# Altium project AIR_SENSE.PrjPcb
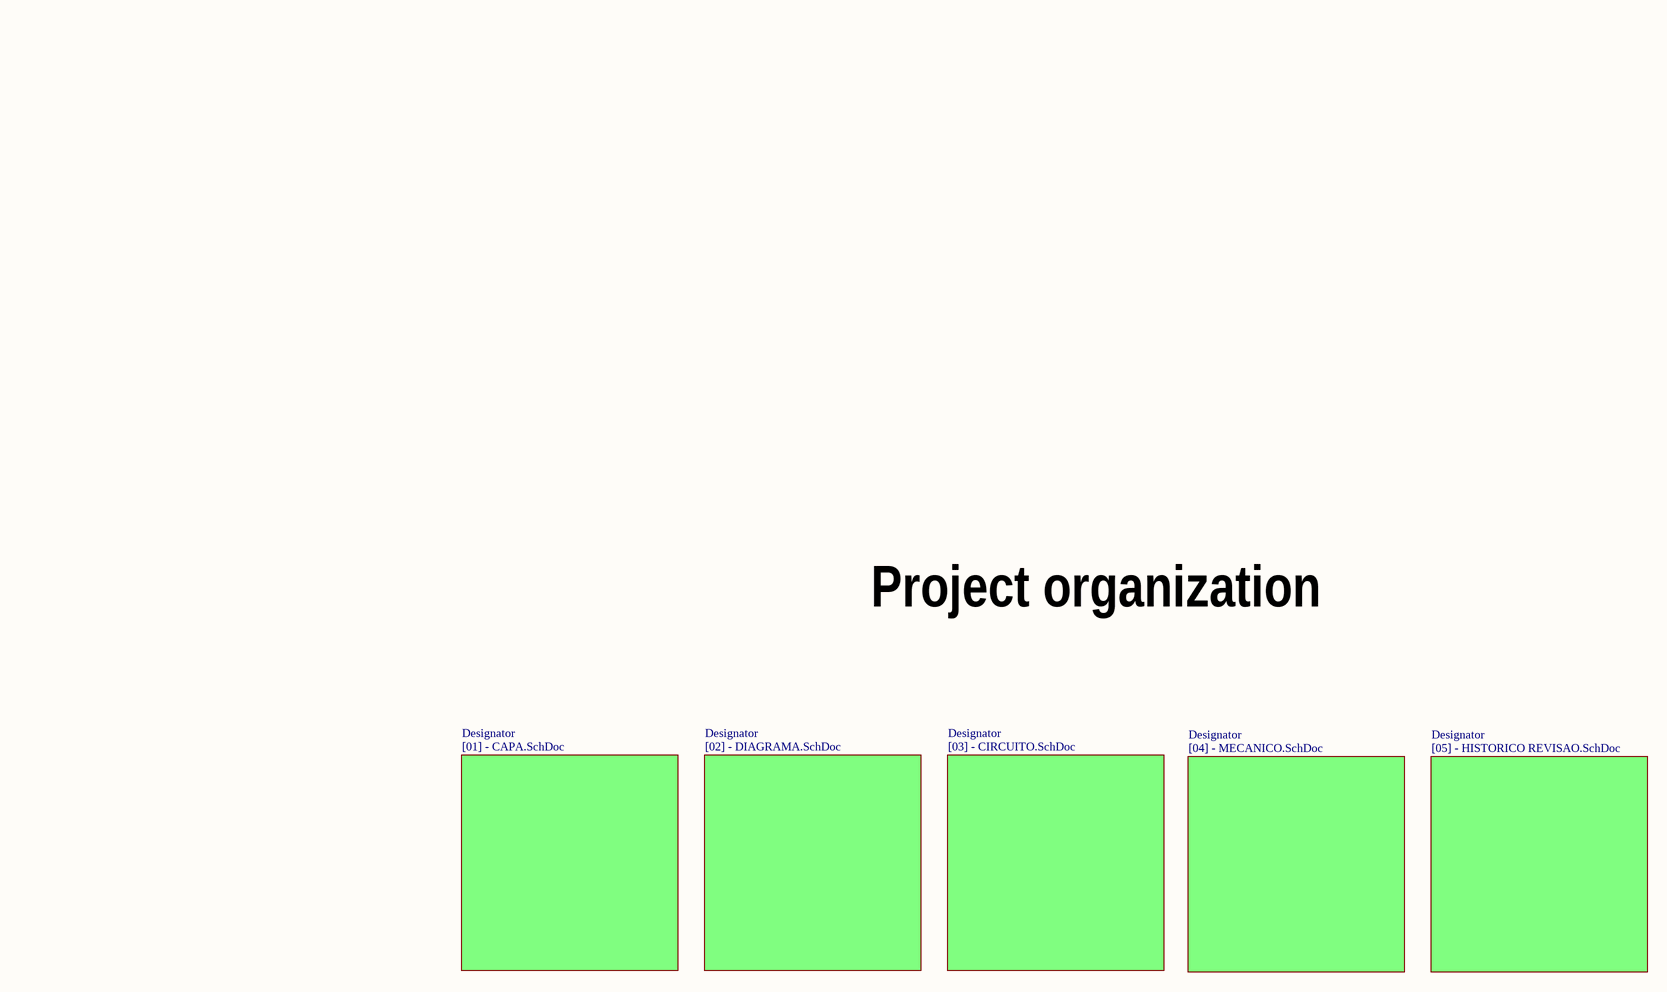
[diagram p0: AIR_SENSE.SchDoc]
VersionRevision: V1I1; Project: AIR SENSE; EngineerName: João P. Bino e Rauhe Abdulhamid; Currency: BR; Assembly_Variant: Completa
6 sheets, 26 parts. Net scope: global (net labels, ports and power ports of the same name join across sheets).
Board file: AIR_SENSE.PcbDoc
Sheets:
  AIR_SENSE.SchDoc
    Designator = [01] - CAPA.SchDoc
    Designator = [02] - DIAGRAMA.SchDoc
    Designator = [03] - CIRCUITO.SchDoc
    Designator = [04] - MECANICO.SchDoc
    Designator = [05] - HISTORICO REVISAO.SchDoc

## Sheet AIR_SENSE.SchDoc
size A3; CompanyName: KDS; Organization: KDS; DocumentNumber: 1; Revision: V1I1; SheetNumber: 1; SheetTotal: 6; PageSetup: Record=PageOptions|CenterHorizontal=True|CenterVertical=True|PrintScale=1.07|XCorrection=1.00|YCorrection=1.00|PrintKind=1|BorderSize=5000000|LeftOffset=0|BottomOffset=0|Orientation=2|PaperLength=1000|PaperWidth=1000|Scale=100|PaperSource=7|PrintQuality=600|MediaType=1|DitherType=10|PaperKind=A3|PrintScaleMode=1; ProjectName: KDS C6A816x Module

### Sub-sheets
Designator = [01] - CAPA.SchDoc: no entries
Designator = [02] - DIAGRAMA.SchDoc: no entries
Designator = [03] - CIRCUITO.SchDoc: no entries
Designator = [04] - MECANICO.SchDoc: no entries
Designator = [05] - HISTORICO REVISAO.SchDoc: no entries

### Notes on the sheet
- Project organization
- Project:
- Revision:
- Engineer:
- Title:
- Pag
- of
- Embedded Things
- Date:
- Hour:
- Variant:

## Sheet [01] - CAPA.SchDoc
size A3; DocumentNumber: 2; SheetNumber: 2; SheetTotal: 6
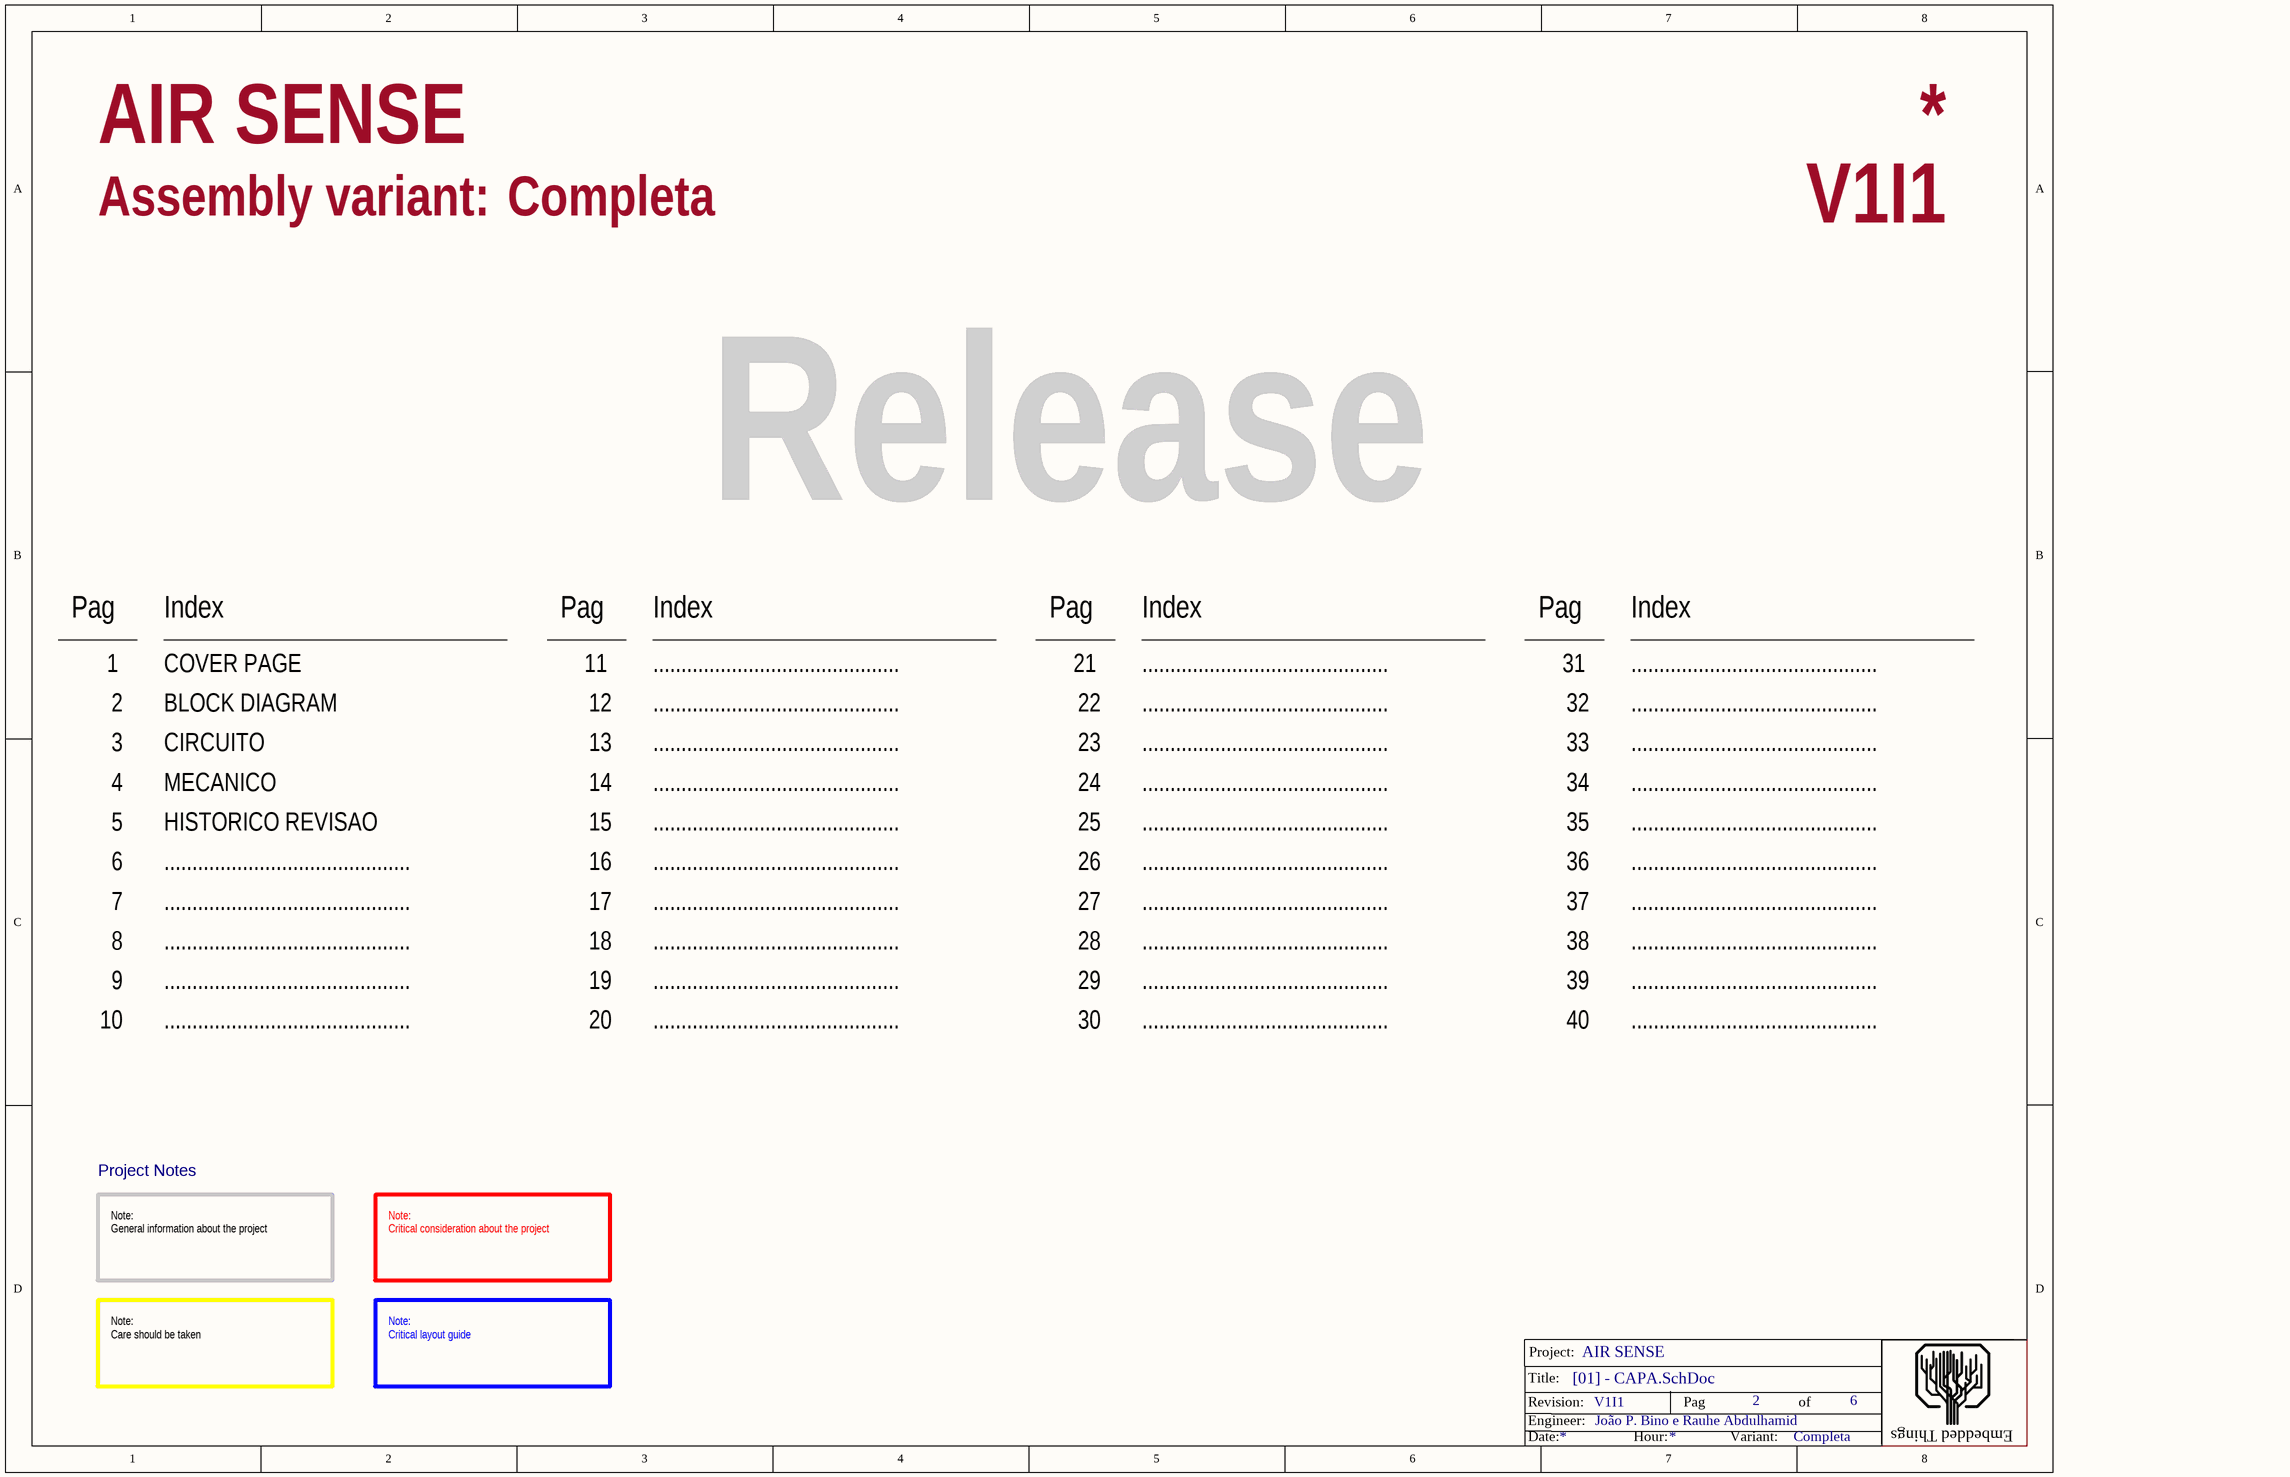
[diagram p1: [01] - CAPA.SchDoc]

### Notes on the sheet
- Assembly variant:
- Release
- Pag
- Index
- 1
- COVER PAGE
- 11
- ............................................
- 21
- 31
- 2
- 3
- BLOCK DIAGRAM
- CIRCUITO
- 12
- 13
- 22
- 23
- 32
- 33
- 4
- 5
- MECANICO
- HISTORICO REVISAO
- 14
- 15
- 24
- 25
- 34
- 35
- 6
- 16
- 26
- 36
- 7
- 8
- 17
- 18
- 27
- 28
- 37
- 38
- 9
- 10
- 19
- 20
- 29
- 30
- 39
- 40
- Project Notes
- Note:
  General information about the project
- Note:
  Critical consideration about the project
- Note:
  Care should be taken
- Note:
  Critical layout guide
- Project:
- Revision:
- Engineer:
- Title:
- of
- Embedded Things
- Date:
- Hour:
- Variant:

## Sheet [02] - DIAGRAMA.SchDoc
size A3; DocumentNumber: 3; SheetNumber: 3; SheetTotal: 6
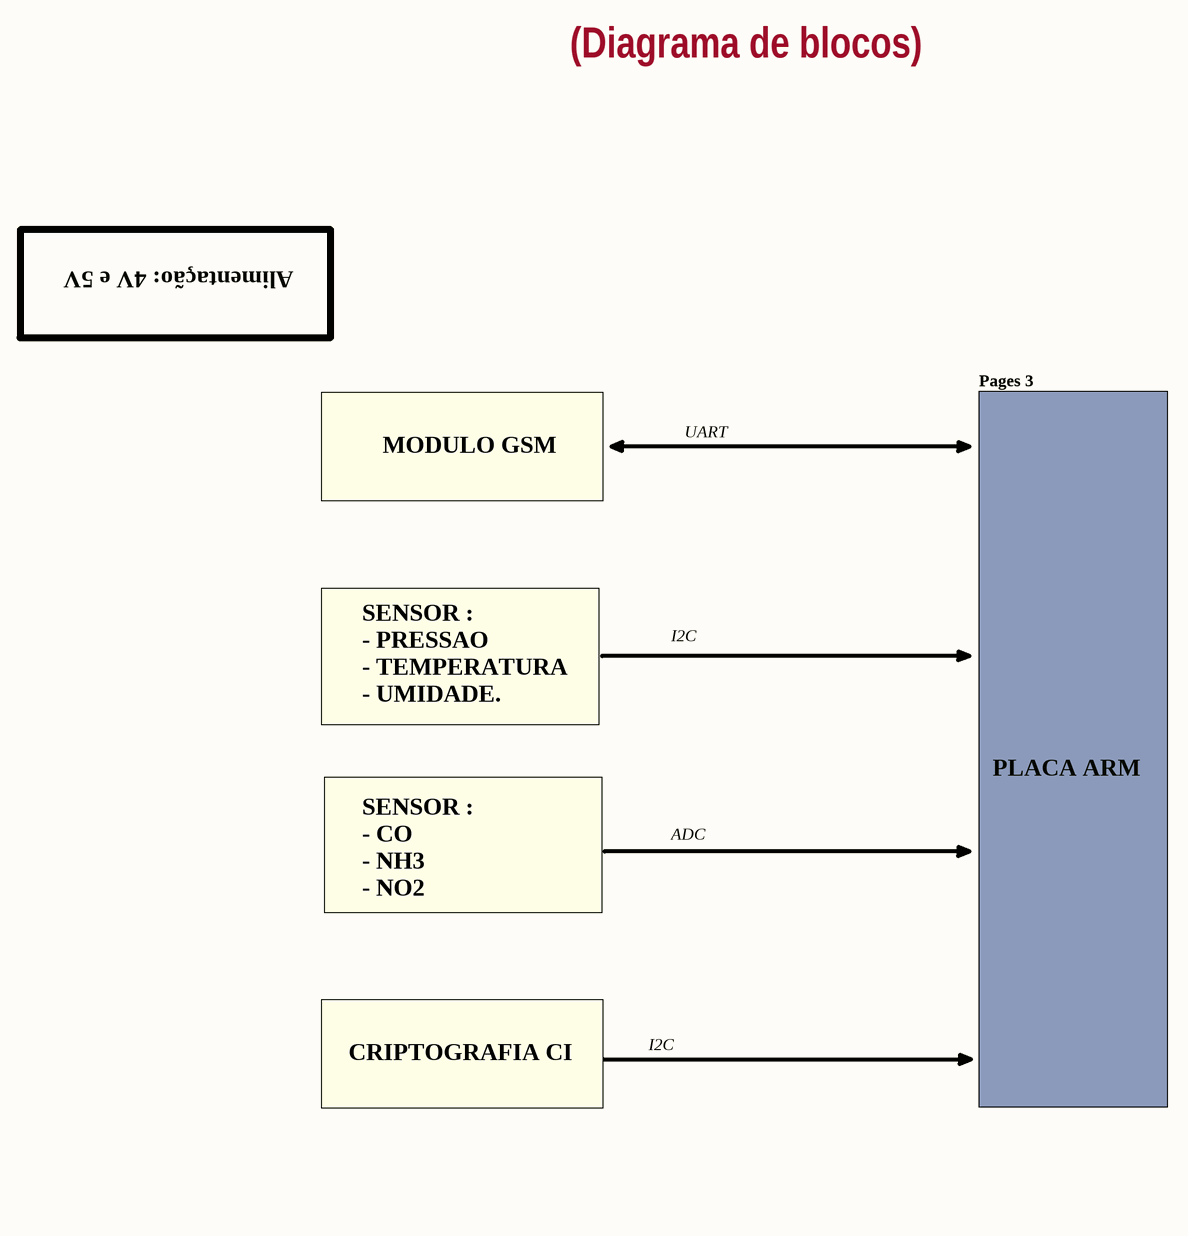
[diagram p2: [02] - DIAGRAMA.SchDoc]

### Notes on the sheet
- (Diagrama de blocos)
- Alimentação: 4V e 5V
- Pages 3
- MODULO GSM
- UART
- I2C
- SENSOR :
  - PRESSAO
  - TEMPERATURA
  - UMIDADE.
- PLACA ARM
- ADC
- SENSOR :
  - CO
  - NH3
  - NO2
- CRIPTOGRAFIA CI
- CLOCKS (CPU & PCIE)
- Project:
- Revision:
- Engineer:
- Title:
- Pag
- of
- Embedded Things
- Date:
- Hour:
- Variant:

## Sheet [03] - CIRCUITO.SchDoc
size A3; DocumentNumber: 4; SheetNumber: 4; SheetTotal: 6
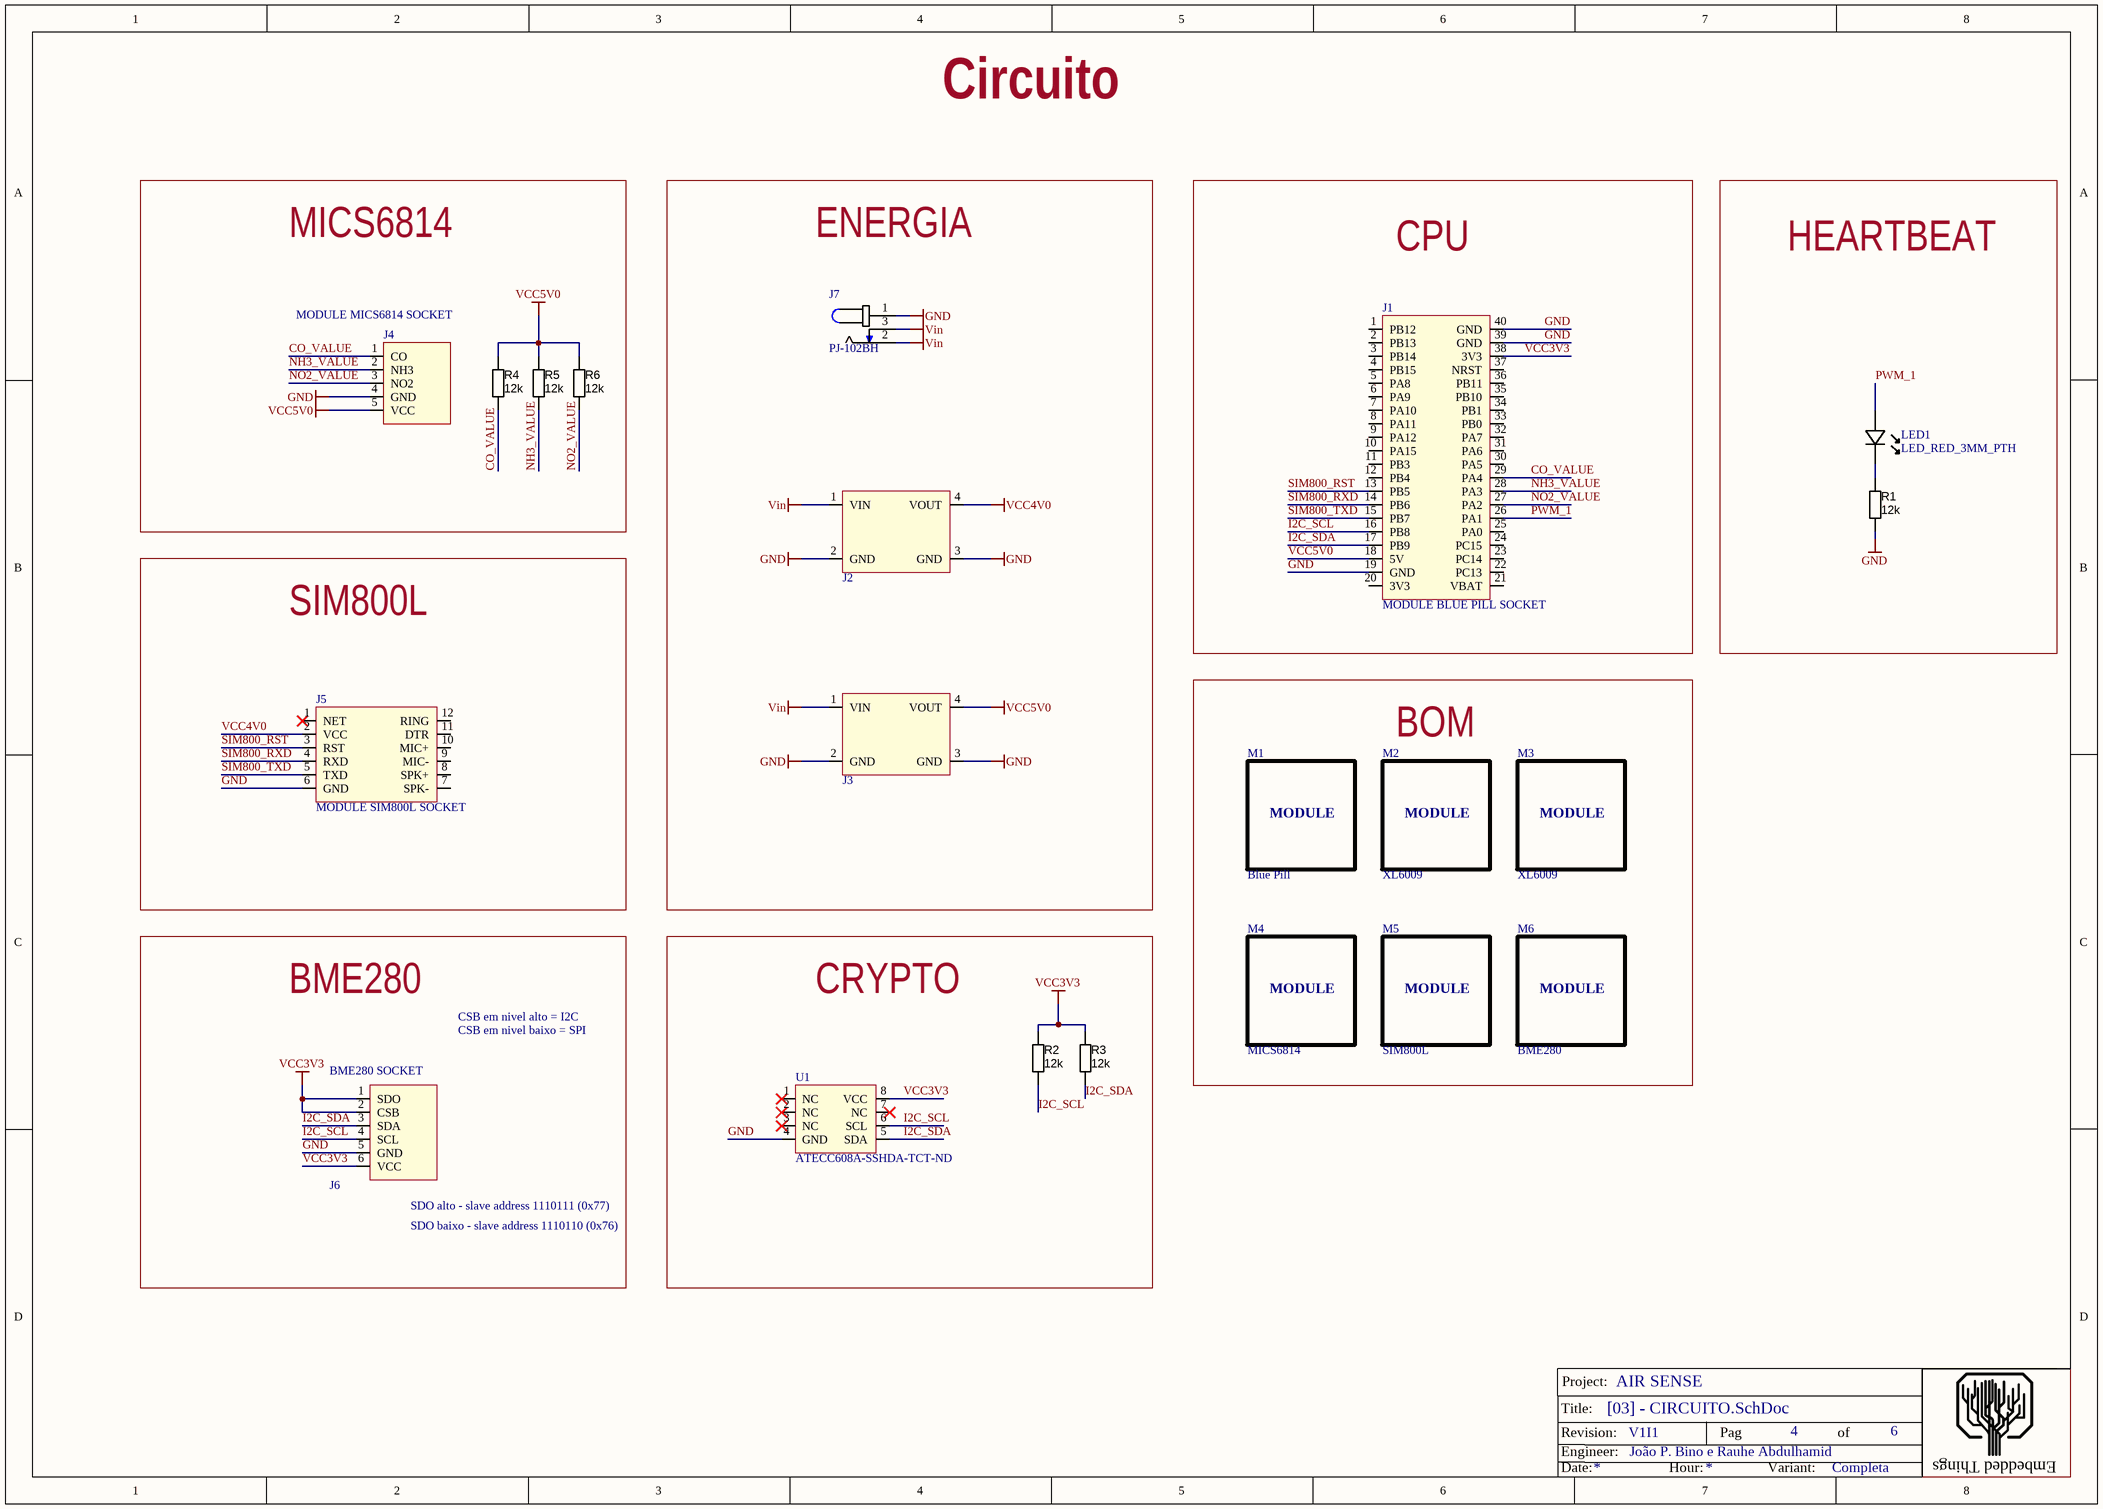
[diagram p3: [03] - CIRCUITO.SchDoc]

### Parts
J1  MODULE BLUE PILL SOCKET  [MODULE BLUE PILL SOCKET]
J2  XL6009  [MODULE DC-DC XL6009 SOCKET]  (value not drawn)
J3  XL6009  [MODULE DC-DC XL6009 SOCKET]  (value not drawn)
J4  MODULE MICS6814 SOCKET  [MODULE MICS6814 SOCKET]
J5  MODULE SIM800L SOCKET  [MODULE SIM800L SOCKET]
J6  Socket  [MODULE BME280 SOCKET]  (value not drawn)
J7  PJ-102BH  [CUI_PJ-102BH]
LED1  LED_RED_3MM_PTH  [LED-3MM-RED]
M1  Blue Pill
M2  XL6009
M3  XL6009
M4  MICS6814
M5  SIM800L
M6  BME280
R1  value 12k  [RESTH_AXIAL-0.4]  (hidden comment: Carbon Film)
R2  value 12k  [RESTH_AXIAL-0.4]  (hidden comment: Carbon Film)
R3  value 12k  [RESTH_AXIAL-0.4]  (hidden comment: Carbon Film)
R4  value 12k  [RESTH_AXIAL-0.4]  (hidden comment: Carbon Film)
R5  value 12k  [RESTH_AXIAL-0.4]  (hidden comment: Carbon Film)
R6  value 12k  [RESTH_AXIAL-0.4]  (hidden comment: Carbon Film)
U1  Supplier Part Number 1: ATECC608A-SSHDA-TCT-ND  [SOIC127P600X175-8AN]  (hidden comment: Authentication Chip)

### Blocks framed on the sheet
MICS6814: J4 R4-R6
ENERGIA: J2 J3 J7
CPU: J1
HEARTBEAT: LED1 R1
SIM800L: J5
BOM: M1-M6
BME280: J6
CRYPTO: R2 R3 U1

### Nets
GND: J1.19(GND) J1.39(GND) J1.40(GND) J2.2(GND) J2.3(GND) J3.2(GND) J3.3(GND) J4.4(GND) J5.6(GND) J6.5(GND) J7.1 R1.1 U1.4(GND)
VCC3V3: J1.38(3V3) J6.1(SDO) J6.2(CSB) J6.6(VCC) R2.2 R3.2 U1.8(VCC)
VCC4V0: J2.4(VOUT) J5.2(VCC)
VCC5V0: J1.18(5V) J3.4(VOUT) J4.5(VCC) R4.2 R5.2 R6.2
Vin: J2.1(VIN) J3.1(VIN) J7.2 J7.3
CO_VALUE: J1.29(PA4) J4.1(CO) R4.1
I2C_SCL: J1.16(PB8) J6.4(SCL) R2.1 U1.6(SCL)
I2C_SDA: J1.17(PB9) J6.3(SDA) R3.1 U1.5(SDA)
NH3_VALUE: J1.28(PA3) J4.2(NH3) R5.1
NO2_VALUE: J1.27(PA2) J4.3(NO2) R6.1
PWM_1: J1.26(PA1) LED1.A
SIM800_RST: J1.13(PB5) J5.3(RST)
SIM800_RXD: J1.14(PB6) J5.4(RXD)
SIM800_TXD: J1.15(PB7) J5.5(TXD)
NetLED1_K: LED1.K R1.2

Not connected (* = marked no-connect by the designer): J1 1(PB12) 2(PB13) 3(PB14) 4(PB15) 5(PA8) 6(PA9) 7(PA10) 8(PA11) 9(PA12) 10(PA15) 11(PB3) 12(PB4) 20(3V3) 21(VBAT) 22(PC13) 23(PC14) 24(PC15) 25(PA0) 30(PA5) 31(PA6) 32(PA7) 33(PB0) 34(PB1) 35(PB10) 36(PB11) 37(NRST); J5 1(NET)* 7(SPK-) 8(SPK+) 9(MIC-) 10(MIC+) 11(DTR) 12(RING); U1 1(NC)* 2(NC)* 3(NC)* 7(NC)*

### Notes on the sheet
- Circuito
- CSB em nivel alto = I2C
- CSB em nivel baixo = SPI
- (near J6) SDO alto - slave address 1110111 (0x77)
- SDO baixo - slave address 1110110 (0x76)
- Project:
- Revision:
- Engineer:
- Title:
- Pag
- of
- Embedded Things
- Date:
- Hour:
- Variant:
- (in symbol MODULE BLUE PILL) MODULE
- (in symbol MODULE BME280) MODULE
- (in symbol MODULE BME280 SOCKET) BME280 SOCKET
- (in symbol MODULE DC-DC XL6009) MODULE
- (in symbol MODULE MICS6814) MODULE
- (in symbol MODULE SIM800L) MODULE

### Library data of the parts
J2 J3 = MODULE DC-DC XL6009 SOCKET
J6 = MODULE BME280 SOCKET: CONN HEADER FEMALE 6POS .1" GOLD; Manufacturer: Sullins Connector Solutions; Manufacturer Part Number: PPPC061LFBN-RC; Number of Positions: 6; Number of Positions Loaded: All; Pitch: 0.100" (2.54mm); Supplier 1: Digi-Key; RoHS: RoHS Compliant; Category: Connectors, Interconnects; Stock 1: 15924; Pricing 1: 1=0.7, 10=0.546, 25=0.5088, 50=0.4626, 100=0.4163, 250=0.35152, 500=0.333, 1000=0.296, 2500=0.24605 (USD); Packaging: Bulk; Connector Type: Header; Contact Type: Female Socket; Number of Rows: 1; Row Spacing: -; Mounting Type: Through Hole; Termination: Solder; Fastening Type: -; Features: -; Contact Finish: Gold; Contact Finish Thickness: Flash; Color: Black; ComponentLink1URL: http://www.sullinscorp.com/drawings/78_P(N)PxCxxxLFBN-RC,_10492-H.pdf; ComponentLink1Description: http://www.sullinscorp.com/drawings/78_P(N)PxCxxxLFBN-RC,_10492-H.pdf; Supplier Part Number 1: S7039-ND
J7 = PJ-102BH: CONN PWR JACK 2.5X5.5MM SOLDER; Manufacturer: CUI Inc.; Gender: Male; Industry Recognized Mating Diameter: 2.50mm ID (0.098"), 5.50mm OD (0.217"); Actual Diameter: 0.098" (2.50mm ID), 0.256" (6.50mm OD); Number of Positions/Contacts: 2 Conductors, 3 Contacts; Internal Switch(s): Single Switch, Normally Closed; Shielding: Unshielded; Voltage - Rated: 24VDC; Mating Length/Depth: 0.354" (9.00mm); Body Color: Black; Material Flammability Rating: UL94 V-0; Value: *; Supplier 1: Digi-Key; Manufacturer Part Number: PJ-102BH; RoHS: RoHS Compliant; Category: Connectors, Interconnects; Stock 1: 7742; Pricing 1: 1=0.77, 10=0.72, 25=0.648, 50=0.576, 100=0.552, 280=0.504, 560=0.48, 1120=0.396, 2520=0.36 (USD); Packaging: Tray; Part Status: Active; Connector Type: Jack; Mounting Type: Through Hole, Right Angle; Mounting Feature: -; Termination: Solder; Features: -; Insulation Color: -; Ingress Protection: -; Contact Material - Plating: Silver; Body Material: -; Operating Temperature: -25°C ~ 85°C; Includes: -; Housing Material: Polybutylene Terephthalate (PBT); Contact Material: Brass; Copper Alloy; Thread Size: -; ComponentLink1URL: https://www.cui.com/product/resource/digikeypdf/pj-102bh.pdf; ComponentLink1Description: https://www.cui.com/product/resource/digikeypdf/pj-102bh.pdf; Supplier Part Number 1: CP-102BH-ND
LED1 = LED_RED_3MM_PTH: LED RED 650NM 3MM RND; Manufacturer: Marktech Optoelectronics; Manufacturer Part Number: MT1403-RG-A; Wavelength - Peak: 700nm; Millicandela Rating: 5mcd; Voltage - Forward (Vf) (Typ): 2.1V; Current - Test: 20mA; Viewing Angle: 35°; Lens Transparency: Clear; Lens Style/Size: Round with Domed Top, 3.00mm; Supplier 1: Digi-Key; RoHS: RoHS Compliant; Category: Optoelectronics; Stock 1: 5274; Pricing 1: 1=0.3, 10=0.219, 25=0.1612, 100=0.115, 250=0.0782, 500=0.069, 1000=0.05405, 2500=0.0529, 5000=0.046 (USD); Packaging: Bulk; Color: Red; Wavelength - Dominant: 650nm; Lens Color: Red; Package / Case: Radial; Supplier Device Package: 3.0mm Round; Size / Dimension: -; Height (Max): 5.10mm; Mounting Type: Through Hole; ComponentLink1URL: http://www.marktechopto.com/products/datasheet/MT1403-RG-A; ComponentLink1Description: http://www.marktechopto.com/products/datasheet/MT1403-RG-A; Supplier Part Number 1: 1125-1182-ND
M1 = MODULE BLUE PILL
M2 M3 = MODULE DC-DC XL6009
M4 = MODULE MICS6814
M5 = MODULE SIM800L
M6 = MODULE BME280
R1-R6 = RES_12K_Axial_0.25W_5%: Resistor THD Axial 12k Ohm 0.25W 5% Carbon Film; Manufacturer 1: Yageo; Manufacturer Part Number 1: CFR-25JB-12K; Ratings: 1/4W; SCDType: spec; Tolerance: ±5%; Package / Case: Axial; Supplier 1: Digi-Key; Supplier Part Number 1: 12KQBK-ND
U1 = ATECC608: Authentication Chip IC Networking and Communications 8-SOIC; Manufacturer: Microchip Technology; Manufacturer Part Number: ATECC608A-SSHDA-T; Supplier 1: Digi-Key; RoHS: RoHS Compliant; Category: Integrated Circuits (ICs); Stock 1: 172; Pricing 1: 1=0.91, 25=0.8644 (USD); Packaging: Cut Tape (CT); Part Status: Active; Type: Authentication Chip; Applications: Networking and Communications; Mounting Type: Surface Mount; Package / Case: 8-SOIC (0.154", 3.90mm Width); Supplier Device Package: 8-SOIC; ComponentLink1URL: http://www.microchip.com/mymicrochip/filehandler.aspx?ddocname=en601565; ComponentLink1Description: http://www.microchip.com/mymicrochip/filehandler.aspx?ddocname=en601565

## Sheet [04] - MECANICO.SchDoc
size A4; DocumentNumber: 5; SheetNumber: 5; SheetTotal: 6
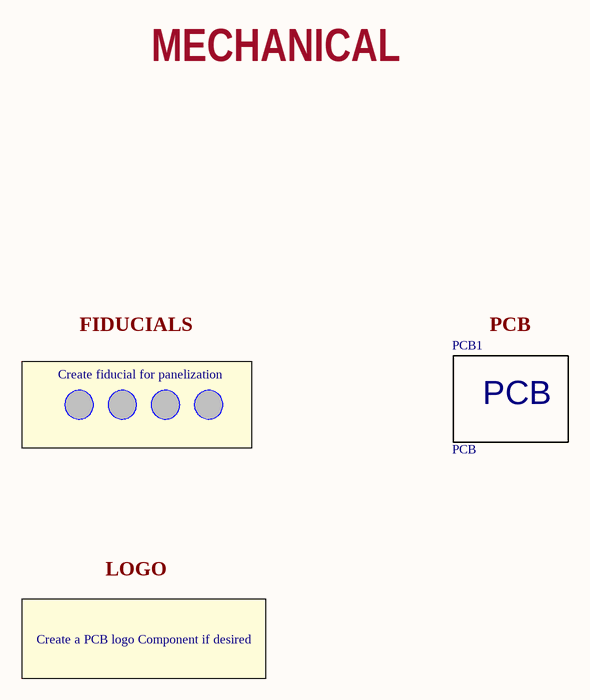
[diagram p4: [04] - MECANICO.SchDoc]

### Parts
FID1  FIDUCIAL  [FIDUCIAL - 1.27mm]  (value not drawn)  (no BOM)
FID2  FIDUCIAL  [FIDUCIAL - 1.27mm]  (value not drawn)  (no BOM)
FID3  FIDUCIAL  [FIDUCIAL - 1.27mm]  (value not drawn)  (no BOM)
FID4  FIDUCIAL  [FIDUCIAL - 1.27mm]  (value not drawn)  (no BOM)
PCB1  PCB

### Blocks framed on the sheet
Create fiducial for panelization: FID1-FID4

### Notes on the sheet
- MECHANICAL
- FIDUCIALS
- PCB
- LOGO
- Create a PCB logo Component if desired
- Project:
- Revision:
- Engineer:
- Title:
- Page
- of
- Embedded Things
- Date:
- Hour:
- Variant:

### Library data of the parts
FID1-FID4 = FIDUCIAL: Pad size: 1.27mm; Value: FIDUCIAL
PCB1 = PCB: Category: Printed Circuit Board

## Sheet [05] - HISTORICO REVISAO.SchDoc
size A3; Engineer: jpnbino; DocumentNumber: 6; SheetNumber: 6; SheetTotal: 6
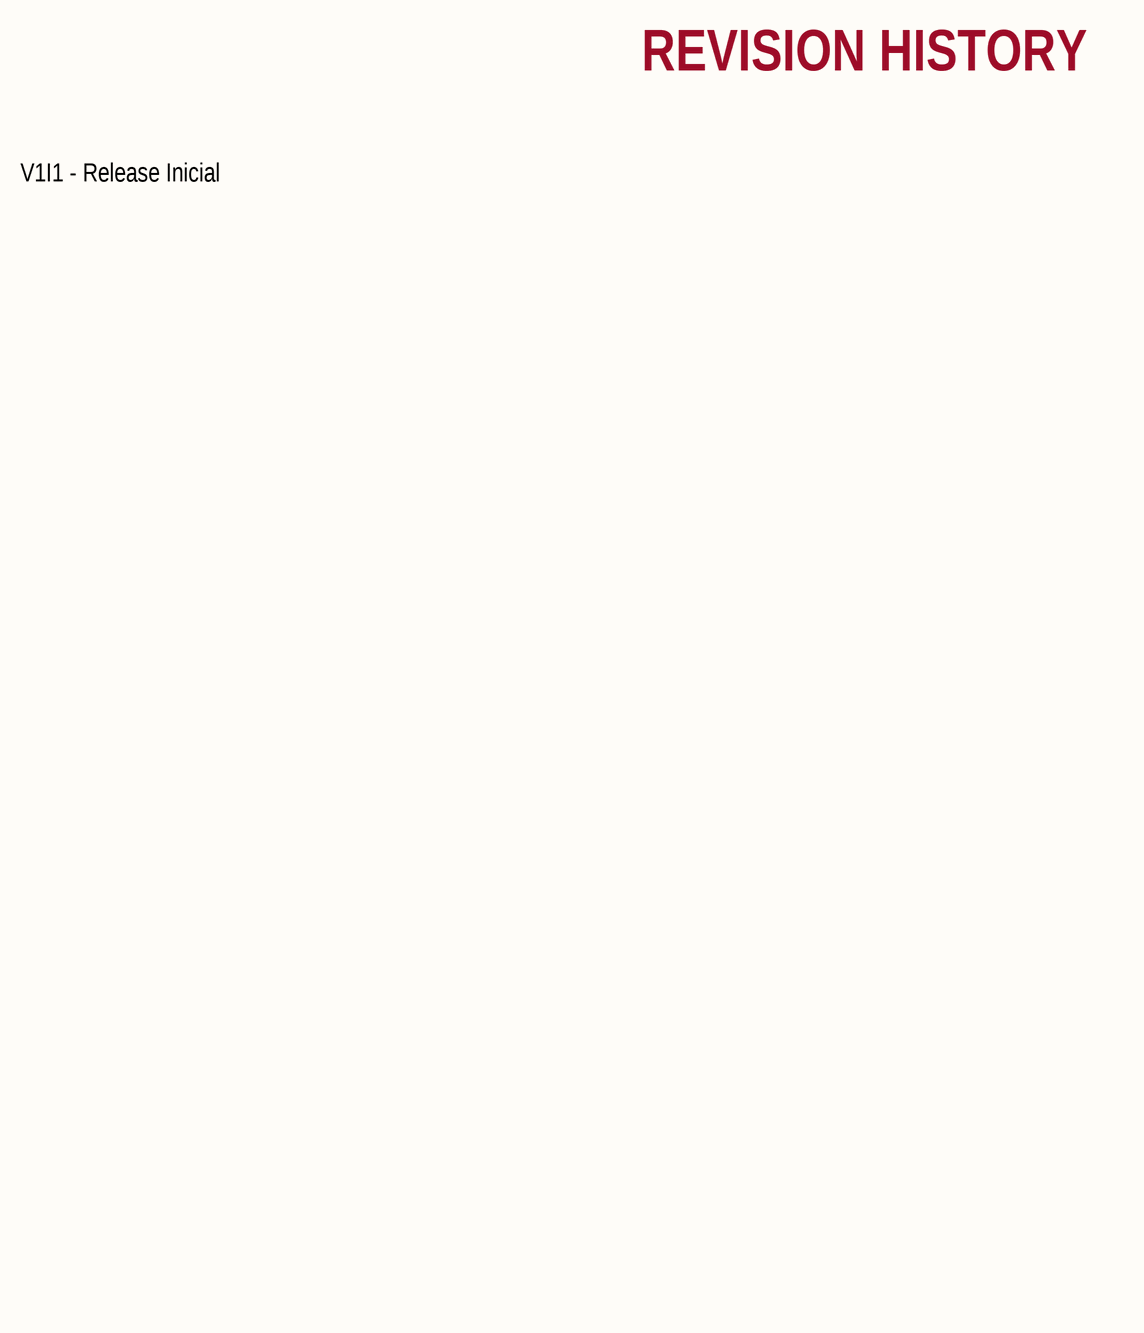
[diagram p5: [05] - HISTORICO REVISAO.SchDoc]

### Notes on the sheet
- REVISION HISTORY
- V1I1 - Release Inicial
- CLOCKS (CPU & PCIE)
- Project:
- Revision:
- Engineer:
- Title:
- Pag
- of
- Embedded Things
- Date:
- Hour:
- Variant: